# EAGLE design tranc_3b (EAGLE 9.6.2)
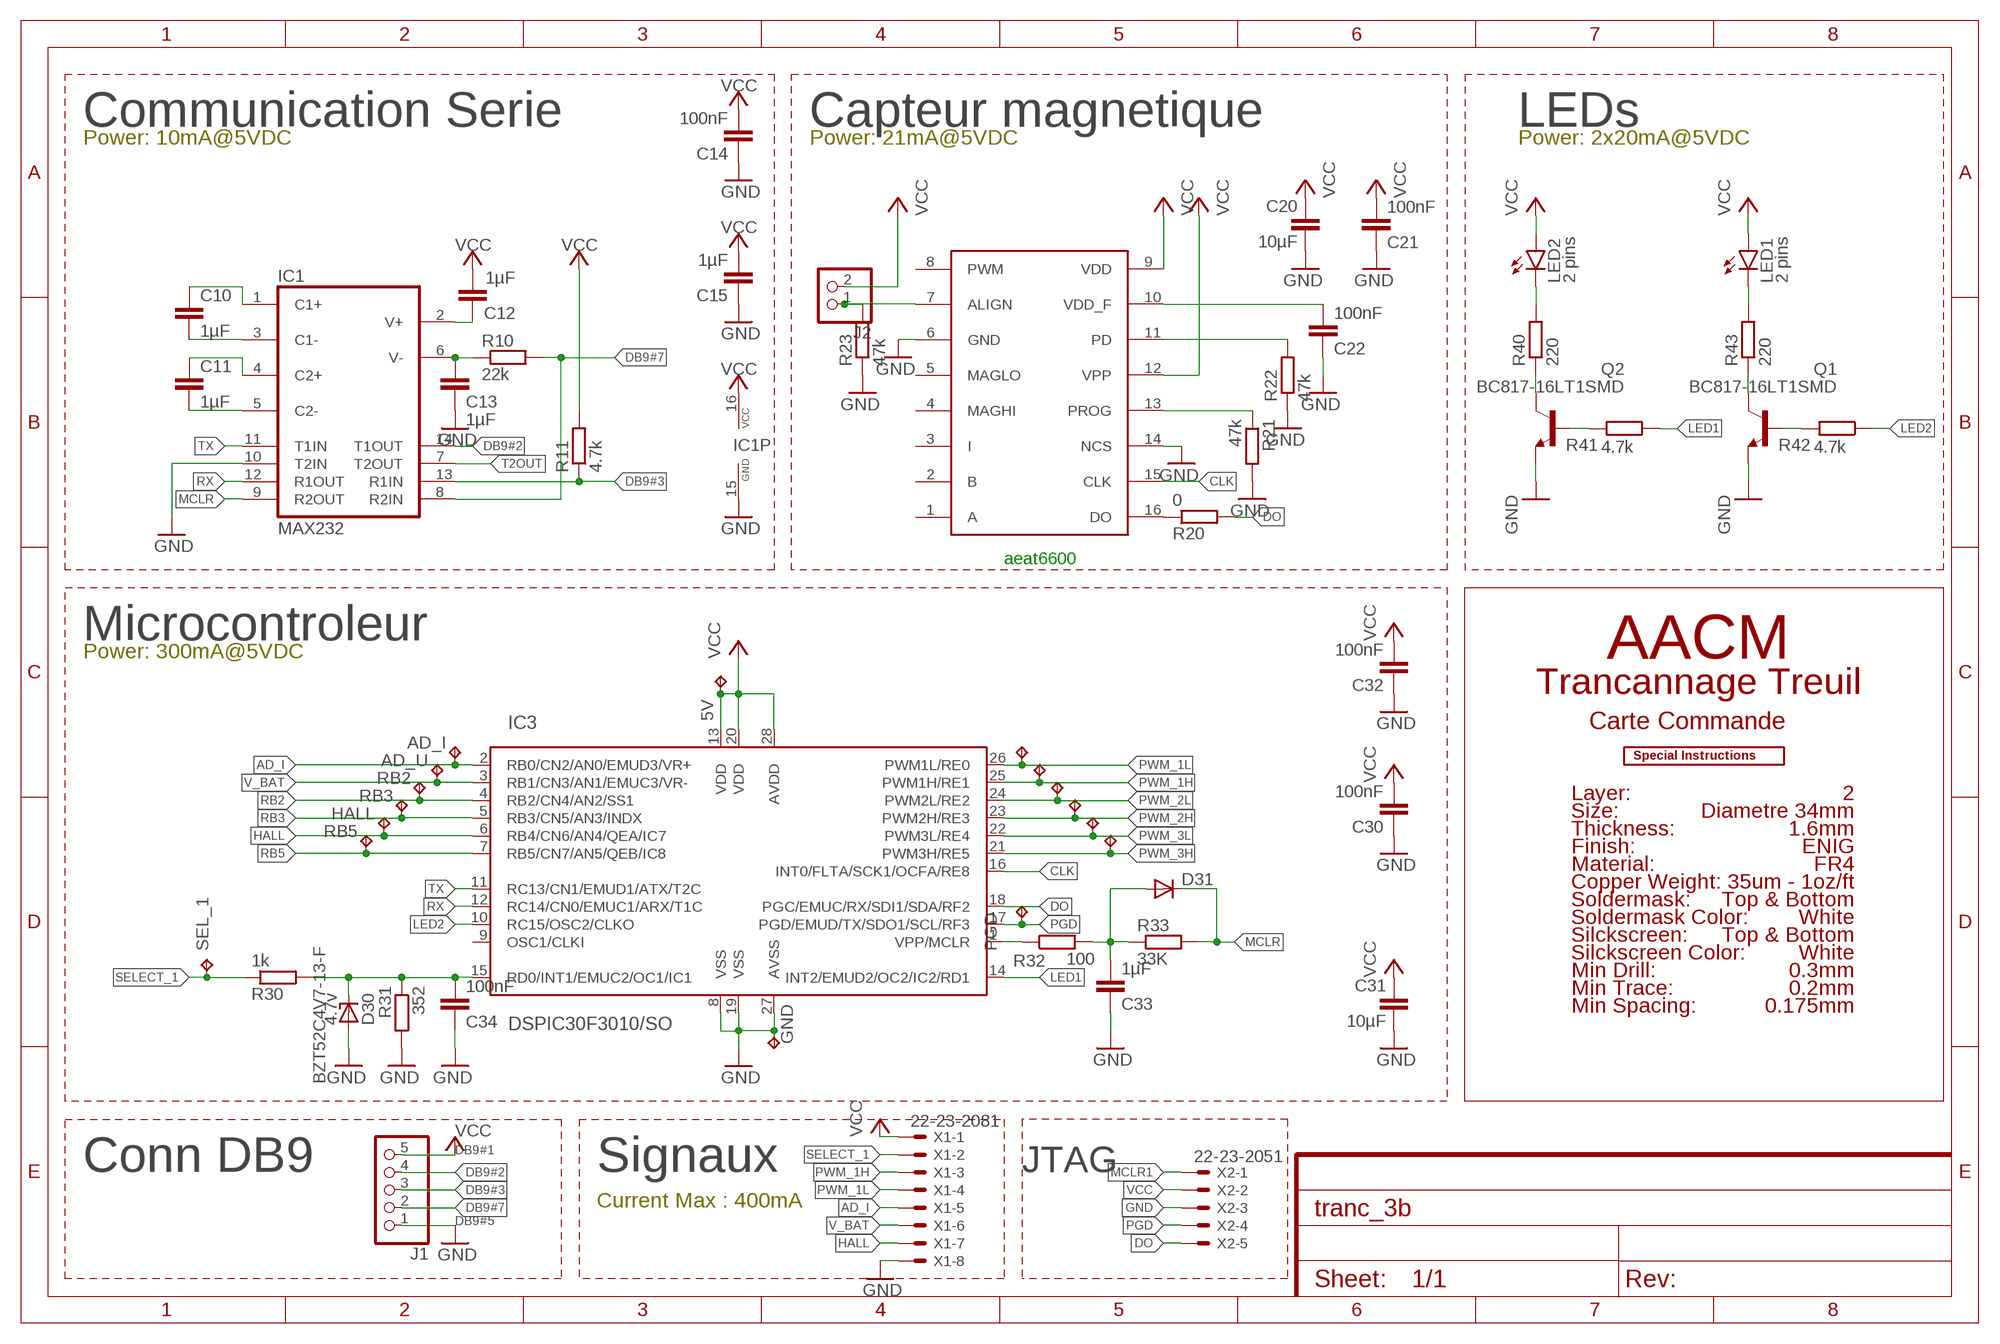
[diagram p0: schematic, sheet 1]

## Parts
1H  TPB1,27  [B1,27]
1L  TPB1,27  [B1,27]
2H  TPB1,27  [B1,27]
2L  TPB1,27  [B1,27]
3H  TPB1,27  [B1,27]
3L  TPB1,27  [B1,27]
5V  TPB1,27  [B1,27]
AD_I  TPB1,27  [B1,27]
AD_U  TPB1,27  [B1,27]
C10  1µF  C-EUC0603  [C0603]
C11  1µF  C-EUC0603  [C0603]
C12  1µF  C-EUC0603  [C0603]
C13  1µF  C-EUC0603  [C0603]
C14  100nF  C-EUC0603  [C0603]
C15  1µF  C-EUC0603  [C0603]
C20  10µF  C-EUC1210  [C1210]
C21  100nF  C-EUC0603  [C0603]
C22  100nF  C-EUC0603  [C0603]
C30  100nF  C-EUC0603  [C0603]
C31  10µF  C-EUC1210  [C1210]
C32  100nF  C-EUC0603  [C0603]
C33  1µF  C-EUC0603  [C0603]
C34  100nF  C-EUC0603  [C0603]
D30  4.7v  ZENER-DIODESOD80C  [SOD80C]
D31  DIODE-MINIMELF  [MINIMELF]
GND  TPB1,27  [B1,27]
HALL  TPB1,27  [B1,27]
IC1  MAX232  [SO16]
IC2  AVAGO_AEAT-6600TSSOP16  [AVAGO_TSSOP16]
IC3  DSPIC30F3010/SO  [SO-28W]
J1  PINHD-1X55X2MM  [1_05X2MM]
J2  PINHD-1X2  [1X02]
LED1  2 pins  LED3MM  [LED3MM]
LED2  2 pins  LED3MM  [LED3MM]
PGD  TPB1,27  [B1,27]
Q1  BC817-16LT1SMD  [SOT23-BEC]
Q2  BC817-16LT1SMD  [SOT23-BEC]
R10  22k  R-EU_R0603  [R0603]
R11  4.7k  R-EU_R0603  [R0603]
R20  0  R-EU_R0603  [R0603]
R21  47k  R-EU_R0603  [R0603]
R22  47k  R-EU_R0603  [R0603]
R23  47k  R-EU_R0603  [R0603]
R30  1k  R-EU_R0603  [R0603]
R31  352  R-EU_R0603  [R0603]
R32  100  R-EU_R0603  [R0603]
R33  33K  R-EU_R0603  [R0603]
R40  220  R-EU_R0603  [R0603]
R41  4.7k  R-EU_R0603  [R0603]
R42  4.7k  R-EU_R0603  [R0603]
R43  220  R-EU_R0603  [R0603]
RB2  TPB1,27  [B1,27]
RB3  TPB1,27  [B1,27]
RB5  TPB1,27  [B1,27]
SEL_1  TPB1,27  [B1,27]
U$1  SPECIAL_INSTRUCTIONS-PRODUCTION  [PRODUCTION_INSTRUCTIONS]
X1  22-23-2081  [22-23-2081]
X2  22-23-2051  [22-23-2051]

## Nets
AD_I: AD_I.TP IC3.2(RB0/CN2/AN0/EMUD3/VR+) X1.5
ALIGN: IC2.7(ALIGN) J2.1 R23.2
BASEL1: Q1.C R43.1
BASEL2: Q2.C R40.1
C1+: C10.1 IC1.1(C1+)
C1-: C10.2 IC1.3(C1-)
C2+: C11.1 IC1.4(C2+)
C2-: C11.2 IC1.5(C2-)
CLK: IC2.15(CLK) IC3.16(INT0/FLTA/SCK1/OCFA/RE8)
DB9#2: IC1.14(T1OUT) J1.4
DB9#3: IC1.13(R1IN) J1.3 R11.1
DB9#7: IC1.8(R2IN) J1.2 R10.2
DO: IC3.18(PGC/EMUC/RX/SDI1/SDA/RF2) R20.2 X2.5
DO_1: IC2.16(DO) R20.1
GND: C13.2 C14.1 C15.1 C20.2 C21.1 C22.1 C30.1 C31.2 C32.1 C33.1 C34.1 D30.A GND.TP IC1.10(T2IN) IC1.15(GND) IC2.6(GND) IC2.14(NCS) IC3.8(VSS) IC3.19(VSS) IC3.27(AVSS) J1.1 Q1.E Q2.E R21.2 R22.1 R23.1 R31.2 X1.8 X2.3
HALL: HALL.TP IC3.6(RB4/CN6/AN4/QEA/IC7) X1.7
KL1: LED1.K(C) R43.2
KL2: LED2.K(C) R40.2
LED1: IC3.14(INT2/EMUD2/OC2/IC2/RD1) R41.1
LED1GATE: Q2.B R41.2
LED2: IC3.10(RC15/OSC2/CLKO) R42.1
LED2GATE: Q1.B R42.2
MCLR: D31.C IC1.9(R2OUT) R33.2
MCLR1: IC3.1(VPP/MCLR) R32.1 X2.1
MCLR2: C33.2 D31.A R32.2 R33.1
PGD: IC3.17(PGD/EMUD/TX/SDO1/SCL/RF3) PGD.TP X2.4
POWERDOWN: IC2.11(PD) R22.2
PROG: IC2.13(PROG) R21.1
PWM_1H: 1H.TP IC3.25(PWM1H/RE1) X1.3
PWM_1L: 1L.TP IC3.26(PWM1L/RE0) X1.4
PWM_2H: 2H.TP IC3.23(PWM2H/RE3)
PWM_2L: 2L.TP IC3.24(PWM2L/RE2)
PWM_3H: 3H.TP IC3.21(PWM3H/RE5)
PWM_3L: 3L.TP IC3.22(PWM3L/RE4)
RB2: IC3.4(RB2/CN4/AN2/SS1) RB2.TP
RB3: IC3.5(RB3/CN5/AN3/INDX) RB3.TP
RB5: IC3.7(RB5/CN7/AN5/QEB/IC8) RB5.TP
RX: IC1.12(R1OUT) IC3.12(RC14/CN0/EMUC1/ARX/T1C)
SELECT: C34.2 D30.C IC3.15(RD0/INT1/EMUC2/OC1/IC1) R30.2 R31.1
SELECT_1: R30.1 SEL_1.TP X1.2
T2OUT: IC1.7(T2OUT)
TX: IC1.11(T1IN) IC3.11(RC13/CN1/EMUD1/ATX/T2C)
V+232: C12.1 IC1.2(V+)
V-232: C13.1 IC1.6(V-) R10.1
V_BAT: AD_U.TP IC3.3(RB1/CN3/AN1/EMUC3/VR-) X1.6
VCC: 5V.TP C12.2 C14.2 C15.2 C20.1 C21.2 C30.2 C31.1 C32.2 IC1.16(VCC) IC2.9(VDD) IC2.12(VPP) IC3.13(VDD) IC3.20(VDD) IC3.28(AVDD) J1.5 J2.2 LED1.A LED2.A R11.2 X1.1 X2.2
VDD_F: C22.2 IC2.10(VDD_F)
Unconnected: IC2.1(A) IC2.2(B) IC2.3(I) IC2.4(MAGHI) IC2.5(MAGLO) IC2.8(PWM) IC3.9(OSC1/CLKI)

## Notes on the sheet
- Communication Serie | Capteur magnetique | LEDs
- Power: 10mA@5VDC | Power: 21mA@5VDC | Power: 2x20mA@5VDC
- aeat6600
- Microcontroleur
- Power: 300mA@5VDC | AACM
- Trancannage Treuil
- Carte Commande
- Layer: | 2
- Size: | Diametre 34mm
- Thickness: | 1.6mm
- Finish: | ENIG
- Material: | FR4
- Copper Weight: | 35um - 1oz/ft
- Soldermask: | Top & Bottom
- Soldermask Color: | White
- Silckscreen: | Top & Bottom
- Silckscreen Color: | White
- Min Drill: | 0.3mm
- Min Trace: | 0.2mm
- Min Spacing: | 0.175mm
- DB9#1
- Conn DB9 | Signaux | JTAG
- Current Max : 400mA
- DB9#5

## Library data of the parts
1H 1L 2H 2L 3H 3L 5V AD_I AD_U GND HALL PGD RB2 RB3 RB5 SEL_1 = testpad:TP: Test pad
C10-C15 C20-C22 C30-C34 = rcl:C-EU: CAPACITOR, European symbol; SPICEPREFIX: C
D30 = diode:ZENER-DIODE: Z-Diode; REF: BZT52C4V7-13-F
D31 = diode:DIODE-: DIODE
IC1 = maxim:MAX232: RS232 TRANSCEIVER; SPICEPREFIX: X
IC2 = aeat_6600_1:AVAGO_AEAT-6600
IC3 = microchip-dspic:DSPIC30F3010: dsPIC Motion Controller DSC
J1 = pinhead:PINHD-1X5: PIN HEADER
J2 = pinhead:PINHD-1X2: PIN HEADER
LED1 LED2 = led:LED: LED OSRAM: - CHIPLED LG R971, LG N971, LY N971, LG Q971, LY Q971, LO R971, LY R971 LH N974, LH R974 LS Q976, LO Q976, LY Q976 LO Q996 - Hyper CHIPLED LW Q18S LB Q993, LB Q99A, LB R99A - SideLED LS A670, LO A670, LY A670, LG A670, LP A670 LB A673, LV A673, LT A673, LW A673 LH A674 LY A675 LS A676, LA A676, LO A676, LY A676, LW A676 LS A679, LY A679, LG A679 - Hyper Micro SIDELED® LS Y876, LA Y876, LO Y876, LY Y876 LT Y87S - SmartLED LW L88C, LW L88S LB L89C, LB L89S, LG L890 LS L89K, LO L89K, LY L89K LS L896, LA L896, LO L896, LY L896 - TOPLED LS T670, LO T670, LY T670, LG T670, LP T670 LSG T670, LSP T670, LSY T670, LOP T670, LYG T670 LG T671, LOG T671, LSG T671 LB T673, LV T673, LT T673, LW T673 LH T674 LS T676, LA T676, LO T676, LY T676, LB T676, LH T676, LSB T676, LW T676 LB T67C, LV T67C, LT T67C, LS T67K, LO T67K, LY T67K, LW E67C LS E67B, LA E67B, LO E67B, LY E67B, LB E67C, LV E67C, LT E67C LW T67C LS T679, LY T679, LG T679 LS T770, LO T770, LY T770, LG T770, LP T770 LB T773, LV T773, LT T773, LW T773 LH T774 LS E675, LA E675, LY E675, LS T675 LS T776, LA T776, LO T776, LY T776, LB T776 LHGB T686 LT T68C, LB T68C - Hyper Mini TOPLED® LB M676 - Mini TOPLED Santana® LG M470 LS M47K, LO M47K, LY M47K Source: http://www.osram.convergy.de LUXEON: - LUMILED® LXK2-PW12-R00, LXK2-PW12-S00, LXK2-PW14-U00, LXK2-PW14-V00 LXK2-PM12-R00, LXK2-PM12-S00, LXK2-PM14-U00 LXK2-PE12-Q00, LXK2-PE12-R00, LXK2-PE12-S00, LXK2-PE14-T00, LXK2-PE14-U00 LXK2-PB12-K00, LXK2-PB12-L00, LXK2-PB12-M00, LXK2-PB14-N00, LXK2-PB14-P00, LXK2-PB14-Q00 LXK2-PR12-L00, LXK2-PR12-M00, LXK2-PR14-Q00, LXK2-PR14-R00 LXK2-PD12-Q00, LXK2-PD12-R00, LXK2-PD12-S00 LXK2-PH12-R00, LXK2-PH12-S00 LXK2-PL12-P00, LXK2-PL12-Q00, LXK2-PL12-R00 Source: www.luxeon.com KINGBRIGHT: KA-3528ASYC Source: www.kingbright.com
Q1 Q2 = transistor-npn:BC817*: NPN Transistor
R10 R11 R20-R23 R30-R33 R40-R43 = rcl:R-EU_: RESISTOR, European symbol; SPICEPREFIX: R
U$1 = SparkFun-Aesthetics:SPECIAL_INSTRUCTIONS: Special Ordering/Production Instructions Alert Symbol for special PCB ordering instructions or unique production process warnings. Ordering Instructions Production Instructions Types of information that should be added to box: Copper weight Soldermask color Silk color PCB thickness Number of layers PCB Standard: 1.6mm FR4 1 oz copper immersion silver plating red soldermask white silkscreen Types of information that should be added to box: Special wash requirements Depaneling instructions Humidification Glue curing Default text settings: 0.07 inch 9% ratio 50% line distance
X1 = con-molex:22-23-2081: .100" (2.54mm) Center Header - 8 Pin; MF: MOLEX; MPN: 22-23-2081; OC_FARNELL: 1756826; OC_NEWARK: 01C7592
X2 = con-molex:22-23-2051: .100" (2.54mm) Center Header - 5 Pin; MF: MOLEX; MPN: 22-23-2051; OC_FARNELL: 1462952; OC_NEWARK: 38C9178

## Board
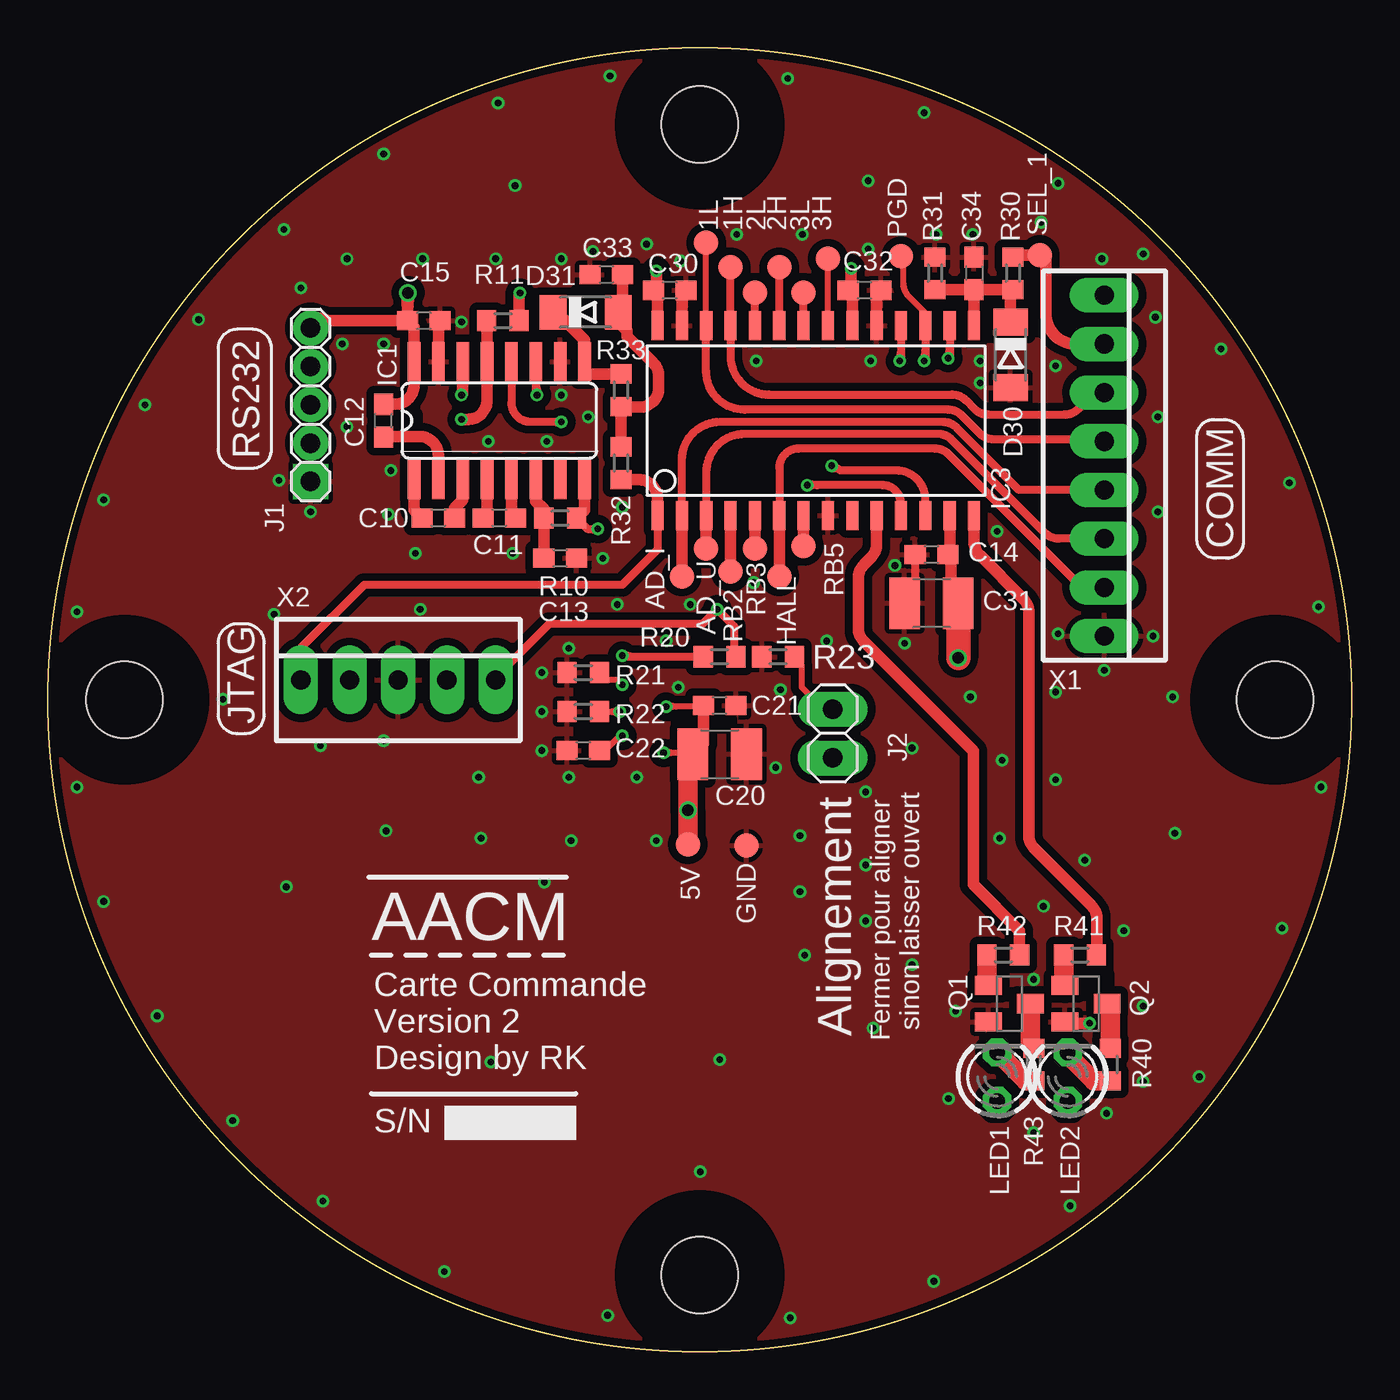
[diagram p1: board, top side]
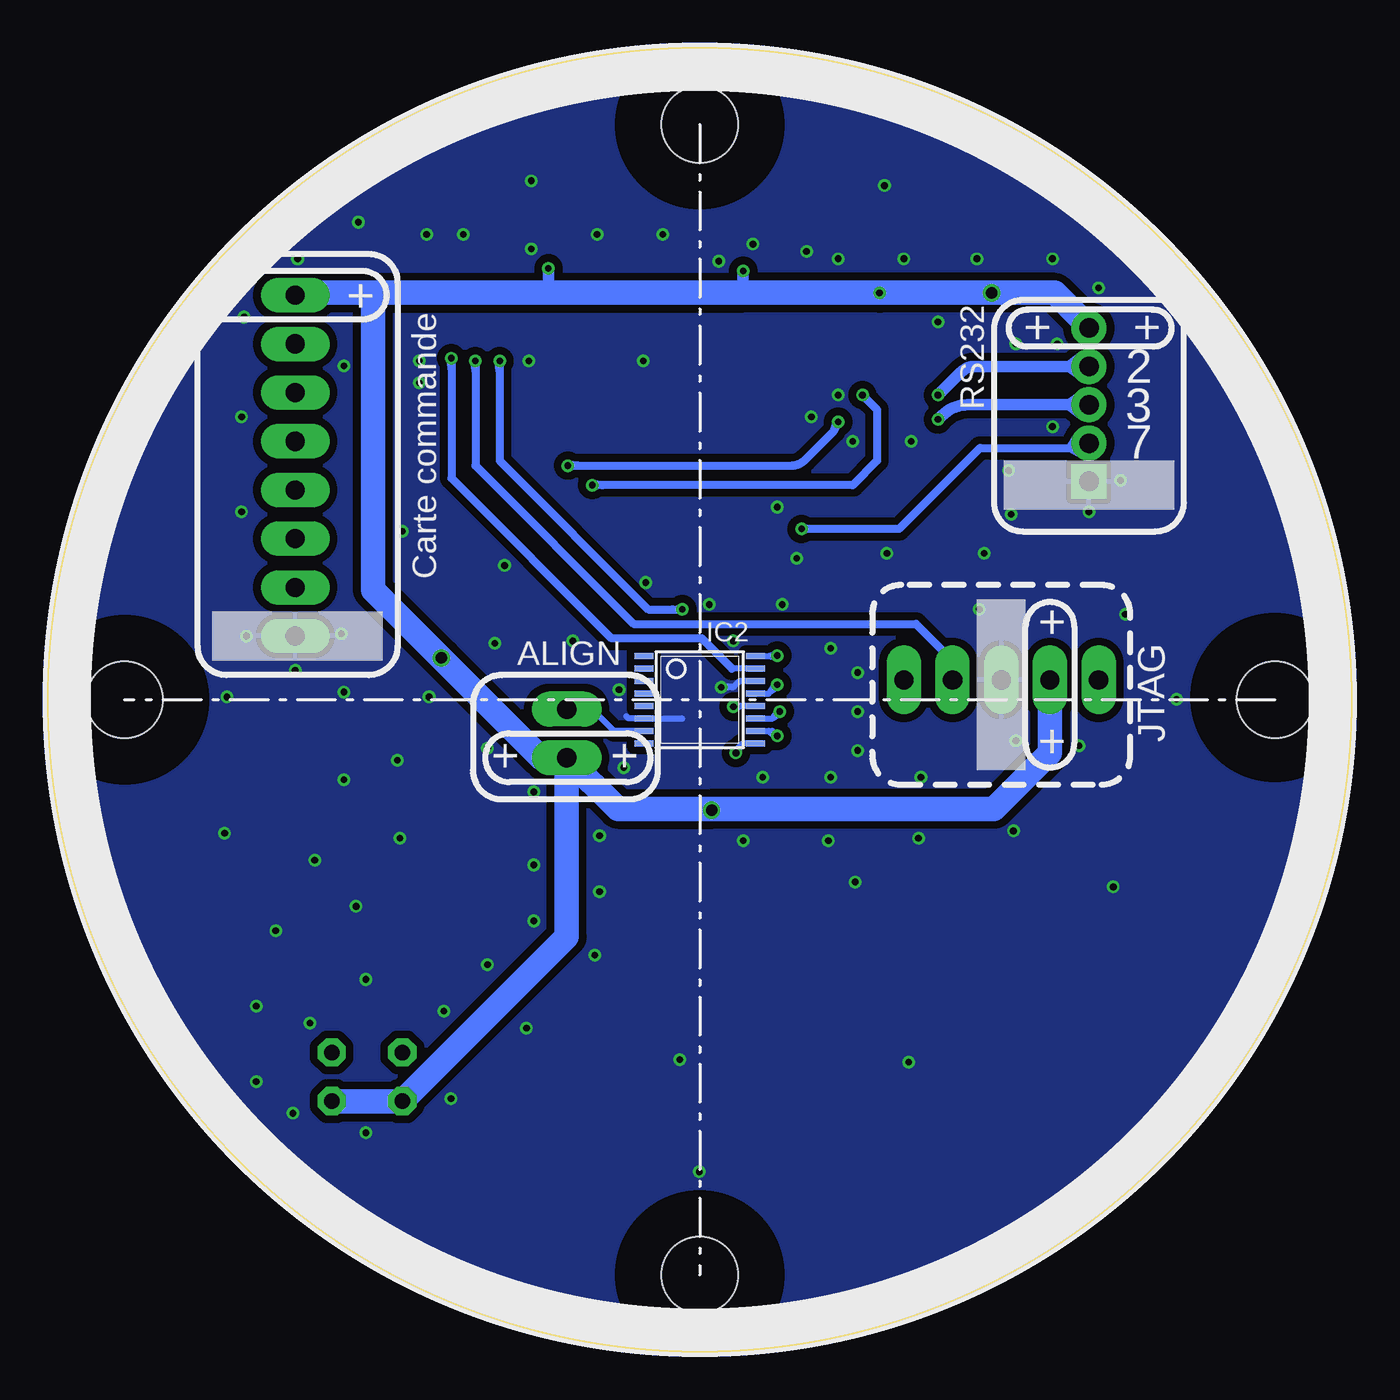
[diagram p2: board, bottom side, seen from below]

Size 68 x 68 mm. Coordinates in mm from the lower left corner, seen from the top.
Outline: circle at 34,34 radius 34
Copper layers (1*16): Top 0.035mm / dielectric 1.6mm / Bottom 0.035mm
Design rules "jlcpcb-2layers *": minimum track width 5mil, minimum drill 0.3mm, track to track 5mil, track to pad 5mil, pad to pad 5mil, via to via 5mil, smd to smd 5mil, copper to edge 0.2mm, drill to drill 6mil, minimum pad ring 10mil, minimum via ring 6mil, stop-mask expansion 4mil, vias tented up to drill 14mil, thermal gap 10mil
Holes 4 mm at 34,64 64,34 4,34 34,4
tRestrict: area 30,60 to 38,68; area 60,30 to 68,38; area 0,30 to 8,38; area 30,0 to 38,8; area 30,60 to 38,68; area 26.5,42 to 27.9,42.7; area 32.6,52.2 to 33.5,52.6; area 34.9,32.6 to 35.5,33; area 54.2,19 to 55.2,19.7; area 18.4,48.1 to 19.2,48.9; area 27.7,55 to 28.6,55.4; area 27.8,34.1 to 28.2,34.8; area 27.8,32.1 to 28.2,32.7; area 50,16.5 to 50.7,17.5; area 52.9,55.7 to 53.5,56
bRestrict: area 30,60 to 38,68; area 0,30.1 to 8,38.1; area 60,30 to 68,38; area 30,0 to 38,8

### Footprints (pad centres in the part's own frame; a part is rotated, then mirrored left to right if it is on the bottom)
B1,27 = smd 1.27 x 1.27: TP 0,0
C0603 = smd 1.1 x 1: 1 -0.85,0; 2 0.85,0
C1210 = smd 1.6 x 2.7: 1 -1.4,0; 2 1.4,0
SOD80C = smd 1.4 x 1.8: A 1.7,0; C -1.7,0
MINIMELF = smd 1.4 x 1.8: A 1.7,0; C -1.7,0
SO16 = smd 0.66 x 2.032: 1 -4.445,-3.073; 2 -3.175,-3.073; 3 -1.905,-3.073; 4 -0.635,-3.073; 5 0.635,-3.073; 6 1.905,-3.073; 7 3.175,-3.073; 8 4.445,-3.073; 9 4.445,3.073; 10 3.175,3.073; 11 1.905,3.073; 12 0.635,3.073; 13 -0.635,3.073; 14 -1.905,3.073; 15 -3.175,3.073; 16 -4.445,3.073
AVAGO_TSSOP16 = smd 0.305 x 0.991: 1 -2.275,-2.918; 2 -1.625,-2.918; 3 -0.975,-2.918; 4 -0.325,-2.918; 5 0.325,-2.918; 6 0.975,-2.918; 7 1.625,-2.918; 8 2.275,-2.918; 9 2.275,2.918; 10 1.625,2.918; 11 0.975,2.918; 12 0.325,2.918; 13 -0.325,2.918; 14 -0.975,2.918; 15 -1.625,2.918; 16 -2.275,2.918
SO-28W = smd 0.635 x 1.524: 1 -7.62,-4.953; 2 -6.35,-4.953; 3 -5.08,-4.953; 4 -3.81,-4.953; 5 -2.54,-4.953; 6 -1.27,-4.953; 7 0,-4.953; 8 1.27,-4.953; 9 2.54,-4.953; 10 3.81,-4.953; 11 5.08,-4.953; 12 6.35,-4.953; 13 7.62,-4.953; 14 8.89,-4.953; 15 8.89,4.953; 16 7.62,4.953; 17 6.35,4.953; 18 5.08,4.953; 19 3.81,4.953; 20 2.54,4.953; 21 1.27,4.953; 22 0,4.953; 23 -1.27,4.953; 24 -2.54,4.953; 25 -3.81,4.953; 26 -5.08,4.953; 27 -6.35,4.953; 28 -7.62,4.953
1_05X2MM = drill 1.016 pad 1.3 square: 1 -4,0 | drill 1.016 pad 1.3: 2 -2,0; 3 0,0; 4 2,0; 5 4,0
1X02 = drill 1.016 long: 1 -1.27,0; 2 1.27,0
LED3MM = drill 0.813 octagon: A -1.27,0; K 1.27,0
SOT23-BEC = smd 1 x 1.4: B -0.95,-1.1; C 0,1.1; E 0.95,-1.1
R0603 = smd 1 x 1.1: 1 -0.85,0; 2 0.85,0
22-23-2081 = drill 1 long: 1 -8.89,0; 2 -6.35,0; 3 -3.81,0; 4 -1.27,0; 5 1.27,0; 6 3.81,0; 7 6.35,0; 8 8.89,0
22-23-2051 = drill 1 long: 1 -5.08,0; 2 -2.54,0; 3 0,0; 4 2.54,0; 5 5.08,0

### Placement (x,y rotation side)
1H  35.61,56.56 270 top
1L  34.34,57.83 180 top
2H  38.15,56.56 270 top
2L  36.88,55.23 180 top
3H  40.69,57.01 180 top
3L  39.42,55.23 180 top
5V  33.38,26.46 270 top
AD_I  33.07,40.43 270 top
AD_U  34.34,41.89 270 top
C10  20.37,43.48 0 top
C11  23.54,43.48 0 top
C12  17.51,48.56 90 top
C13  26.72,41.38 0 top
C14  46.09,41.58 0 top
C15  19.61,53.77 180 top
C20  35.04,31.16 0 top
C21  35.04,33.7 180 top
C22  27.92,31.35 0 top
C30  32.43,55.35 180 top
C31  46.09,39.04 180 top
C32  42.59,55.35 180 top
C33  29.13,56.18 0 top
C34  48.31,56.24 270 top
D30  50.21,51.99 270 top
D31  28.05,54.21 0 top
GND  36.43,26.4 270 top
HALL  38.15,40.43 270 top
IC1  23.54,48.56 0 top
IC2  34,34 270 bottom
IC3  39.42,48.56 0 top
J1  13.7,49.39 90 top
J2  40.94,32.24 270 top
LED1  49.51,14.33 90 top
LED2  53.2,14.33 90 top
PGD  44.5,57.13 180 top
Q1  50.15,18.14 270 top
Q2  54.15,18.14 270 top
R10  26.72,43.48 0 top
R11  23.73,53.77 0 top
R20  35.04,36.24 0 top
R21  27.92,35.42 180 top
R22  27.92,33.38 0 top
R23  38.08,36.24 0 top
R30  50.34,56.24 270 top
R31  46.28,56.24 90 top
R32  29.89,46.34 90 top
R33  29.89,50.15 90 top
R40  55.42,14.97 270 top
R41  53.83,20.68 180 top
R42  49.83,20.68 180 top
R43  51.42,14.97 270 top
RB2  35.61,40.69 180 top
RB3  36.88,41.89 180 top
RB5  39.42,42.02 180 top
SEL_1  51.74,57.2 270 top
U$1  71.74,63.1 0 top  (outside the outline)
X1  55.1,46.21 270 top
X2  18.27,35.03 0 top

### Tracks (layer width: path | path; a pad name or v marks a point on that pad's centre or on a via)
AD_I
  Top 0.406: IC3.2 33.07,46.5 arc-90 35.07,48.5 46.69,48.5 arc-45 47.39,48.2 50.66,44.94 X1.5
  Top 0.61: IC3.2 AD_I.TP
ALIGN
  Top 0.305: R23.2 39.31,35.8 39.31,34.65 40.46,33.51 J2.1
  Bottom 0.305: IC2.7 38.47,32.38 39.61,33.51 J2.1
BASEL1
  Top 1.016: Q1.C 51.25,15.99 R43.1
BASEL2
  Top 1.016: R40.1 55.42,17.97 Q2.C
C1+
  Top 0.61: C10.1 19.1,43.9 IC1.1
C1-
  Top 0.61: IC1.3 21.64,44.41 21.22,43.99 C10.2
C2+
  Top 0.61: IC1.4 22.91,43.7 C11.1
C2-
  Top 0.61: IC1.5 24.18,43.7 C11.2
CLK  (via drill 0.35)
  Top 0.406: IC3.16 47.04,52.34 | 47.04,52.34 47.04,51.9 v46.96,51.82 | 47.04,52.34 46.91,51.83 v46.96,51.82 | 47.04,52.34 47,51.81 v46.96,51.82
  Bottom 0.305: IC2.15 32.32,35.62
  Bottom 0.406: v46.96,51.82 46.96,51.29 | 46.96,51.29 46.96,45.56 38.59,37.19 33.89,37.19 32.32,35.62 | 46.96,51.29 47,51.81 v46.96,51.82 | 46.96,51.29 46.91,51.81 v46.96,51.82
DB9#2  (via drill 0.35)
  Top 0.61: IC1.14 21.64,49.96 v21.57,49.89
  Bottom 0.61: v21.57,49.89 20.38,51.09 arc45 19.67,51.39 14.72,51.39 | 14.72,51.39 J1.4 | 14.72,51.39 14.07,51.87 J1.4 | 14.72,51.39 14.07,50.9 J1.4
DB9#3  (via drill 0.35)
  Top 0.61: R11.1 22.91,53.74 IC1.13 22.91,49.62 arc-90 21.91,48.62 v21.57,48.62
  Bottom 0.61: J1.3 14.72,49.39 | 14.72,49.39 20.02,49.39 arc-45 21.37,48.82 v21.57,48.62 | 14.72,49.39 14.07,49.87 J1.3 | 14.72,49.39 14.07,48.9 J1.3
DB9#7  (via drill 0.35)
  Top 0.406: R10.2 28.14,42.91 28.16,42.91 | 28.16,42.91 v28.69,42.91 | 28.16,42.91 28.68,42.86 v28.69,42.91 | 28.16,42.91 28.68,42.96 v28.69,42.91
  Top 0.61: IC1.8 27.99,43.9 R10.2
  Bottom 0.406: 28.16,42.91 23.61,42.91 19.38,47.13 14.68,47.13 | 28.16,42.91 v28.69,42.91 | 14.68,47.13 13.95,47.13 J1.2 | 28.16,42.91 28.68,42.86 v28.69,42.91 | 28.16,42.91 28.68,42.96 v28.69,42.91 | 14.68,47.13 14.31,47.75 J1.2 | 14.68,47.13 14.05,46.77 J1.2
DO  (via drill 0.35)
  Top 0.406: IC3.18 44.5,52.19 | 44.5,52.19 44.5,51.74 v44.43,51.67 | v34.91,38.72 35.28,38.35 | 35.28,38.35 35.8,37.83 35.8,36.33 R20.2 | v34.91,38.72 34.54,38.35 | 34.54,38.35 34.15,37.96 26.15,37.96 23.35,35.16 X2.5 | 44.5,52.19 44.39,51.68 v44.43,51.67 | 44.5,52.19 44.48,51.67 v44.43,51.67 | 35.28,38.35 34.95,38.75 v34.91,38.72 | 35.28,38.35 34.88,38.68 v34.91,38.72 | 34.54,38.35 34.94,38.68 v34.91,38.72 | 34.54,38.35 34.87,38.75 v34.91,38.72
  Bottom 0.406: v44.43,51.67 44.43,51.15 | 44.43,51.15 44.43,46.47 36.69,38.72 35.43,38.72 | 35.43,38.72 v34.91,38.72 | 44.43,51.15 44.48,51.67 v44.43,51.67 | 44.43,51.15 44.39,51.67 v44.43,51.67 | 35.43,38.72 34.91,38.77 v34.91,38.72 | 35.43,38.72 34.91,38.67 v34.91,38.72
DO_1  (via drill 0.35)
  Top 0.406: R20.1 30.48,36.24 | 30.48,36.24 30.02,36.24 v29.96,36.3 | 30.48,36.24 29.97,36.35 v29.96,36.3 | 30.48,36.24 29.95,36.26 v29.96,36.3
  Bottom 0.254: 29.99,36.27 v29.96,36.3
  Bottom 0.305: IC2.16 30.48,36.27 | 30.48,36.27 29.99,36.27 | 30.48,36.27 29.98,36.4 v29.96,36.3 29.97,36.21 30.48,36.27
GND  (via drill 0.35)
  Top 0.406: C14.1 45.23,39.59 C31.2
  Top 0.61: IC1.15 20.37,53.68 C15.1 | IC3.19 43.23,55.14 C32.1 | IC3.27 33.07,55.14 C30.1 | v54.34,17.13 53.12,17.13 Q2.E
  Bottom 0.305: 34.91,33 34.93,33.02 IC2.6 37.73,33.02 37.83,33.13 | IC2.14 31.92,34.98 32.24,34.65 32.35,34.65 | 32.35,34.65 v32.88,34.65 | 32.35,34.65 32.86,34.56 v32.88,34.65 | 32.35,34.65 32.86,34.75 v32.88,34.65
  other vias: 29.32,66.53 38.59,66.4 66.28,38.84 66.41,29.45 38.72,1.76 29.19,1.89 1.51,29.45 1.51,38.59 9.13,34.02 34.02,9.38 58.66,34.15 28.43,57.39 26.78,49.89 21.57,53.7 28.94,41.38 19.16,41.64 15.61,48.24 17.76,43.67 13.7,43.8 12.05,45.45 17.51,52.56 37.96,30.46 44.18,41 44.69,36.94 57.64,37.32 55.1,35.54 52.69,37.45 48.62,50.53 48.62,51.67 2.91,23.48 5.7,17.51 9.64,12.05 14.34,7.86 20.68,4.17 46.21,3.67 53.32,7.6 60.05,14.33 64.37,22.08 64.75,45.32 61.2,52.31 57.13,57.26 52.69,60.94 45.7,64.63 2.91,44.43 5.06,49.39 7.86,53.83 12.3,58.53 17.51,62.47 23.48,65.13 17.51,31.86 19.41,38.72 24.37,60.82 42.78,61.07 51.42,11.41 46.97,13.19 43.04,16.87 39.48,20.68 39.23,23.99 39.23,26.91 42.66,29.19 42.66,25.38 42.66,22.46 45.07,20.18 47.35,17.76 45.07,31.48 48.12,34.15 52.56,34.4 52.56,29.83 54.09,25.64 56.12,21.95 57.13,18.02 57.13,14.08 55.23,12.43 25.77,31.35 14.21,31.61 12.43,24.24 25.89,24.49 23.1,15.1 13.19,55.48 15.61,57.01 19.54,57.01 23.35,57.01 26.78,57.01 31.23,57.77 33,56.88 35.92,58.28 39.35,58.28 42.78,57.51 46.34,58.28 48.24,58.28 51.8,58.91 54.98,57.01 57.77,53.96 57.9,48.75 57.9,43.8 35.04,15.22 58.78,27.03 36.94,51.67 42.91,51.67 22.97,47.48 22.46,29.95 51.93,23.22 49.77,30.84 49.64,26.78 52.56,51.42 40.62,37.07 27.16,29.95 30.72,29.95 25.77,33.38 25.77,35.42 24.24,41.64 11.79,38.46 28.18,48.75 15.35,52.56 17.89,45.96 29.7,38.97 27.16,36.69 33.51,38.97 38.21,34.53 31.73,26.65 27.29,26.65 22.59,26.78 17.64,27.16 51.42,19.41 26.02,47.48 29.96,44.05 32.24,37.07 36.81,40.11 49.51,42.78
  pour Top (isolate 0.406, rank 6): -1,69 69.45,69.39 69.45,-1.54 -1,-1
  pour Bottom (isolate 0.406): -1,69 71,69 69.71,-1.54 -1,-1.54
HALL
  Top 0.406: 38.15,44.05 38.15,46.1 arc-90 39.15,47.1 46.27,47.1 arc-45 46.98,46.81 53.93,39.86 X1.7
  Top 0.61: HALL.TP IC3.6 38.15,44.05
KL1
  Top 1.016: LED1.K 51,14.12 R43.2
KL2
  Top 1.016: R40.2 54.55,14.12 53.2,15.48 LED2.K
LED1
  Top 0.61: IC3.14 48.31,42.24 arc45 48.6,41.54 50.87,39.27 arc-45 51.16,38.56 51.16,26.94 arc45 51.46,26.23 54.43,23.26 arc-45 54.72,22.56 54.72,20.72 R41.1
LED1GATE
  Top 1.016: R41.2 52.98,19.16 Q2.B
LED2
  Top 0.61: IC3.10 43.23,42.12 arc-45 42.94,41.41 42.57,41.04 arc45 42.27,40.34 42.27,37.73 arc45 42.57,37.03 48.27,31.33 48.27,24.37 50.68,21.95 R42.1
LED2GATE
  Top 1.016: R42.2 48.98,19.16 Q1.B
MCLR
  Top 0.61: D31.C 26.53,54.21 27.99,52.75 IC1.9 27.99,51.23 28.22,51 R33.2
MCLR1
  Top 0.305: 13.19,36.69 X2.1
  Top 0.406: 13.19,36.69 16.49,39.99 29.96,39.99 31.8,41.83 IC3.1
  Top 0.61: IC3.1 31.8,44.49 arc90 30.8,45.49 R32.1
MCLR2
  Top 0.61: C33.2 29.98,54.44 D31.A 29.75,53.7 30.21,53.24 30.21,52.94 31.57,51.58 arc-45 31.86,50.88 31.86,50.26 arc-90 30.86,49.26 29.93,49.26 R33.1 R32.2
PGD  (via drill 0.35)
  Top 0.305: IC3.17 45.77,54.17 44.9,55.04 arc-45 44.61,55.74 44.61,57.02 PGD.TP
  Top 0.406: IC3.17 45.77,52.19 | 45.77,52.19 45.77,51.74 v45.7,51.67 | 45.77,52.19 45.66,51.68 v45.7,51.67 | 45.77,52.19 45.75,51.67 v45.7,51.67
  Bottom 0.406: v45.7,51.67 45.7,51.15 | 45.7,51.15 45.7,46.21 37.45,37.96 22.72,37.96 20.81,36.05 X2.4 | 45.7,51.15 45.75,51.67 v45.7,51.67 | 45.7,51.15 45.66,51.67 v45.7,51.67
POWERDOWN  (via drill 0.35)
  Top 0.305: R22.2 28.88,33.17 28.98,33.17 29.19,33.38 29.3,33.38 | 29.3,33.38 v29.83,33.38 | 29.3,33.38 29.81,33.29 v29.83,33.38 | 29.3,33.38 29.81,33.48 v29.83,33.38
  Bottom 0.305: IC2.11 30.21,33.02 | 30.21,33.02 30.19,33.02 v29.83,33.38 | 30.21,33.02 29.91,33.44 v29.83,33.38 | 30.21,33.02 29.78,33.3 v29.83,33.38
PROG  (via drill 0.35)
  Top 0.305: v29.96,34.78 29.7,35.03 29.16,35.03 R21.1 | v29.96,34.78 29.9,34.75 29.71,35.02 29.99,34.84 v29.96,34.78
  Bottom 0.305: IC2.13 30.41,34.33 30.33,34.41 | 30.33,34.41 v29.96,34.78 | 30.33,34.41 30.04,34.84 v29.96,34.78 | 30.33,34.41 29.9,34.7 v29.96,34.78
PWM_1H
  Top 0.406: 1H.TP IC3.25 35.61,51.92 arc90 37.61,49.92 47.17,49.92 arc-45 47.88,49.63 48.33,49.17 arc45 49.04,48.88 53.04,48.88 arc45 53.74,49.17 54.59,50.02 X1.3
PWM_1L
  Top 0.305: IC3.26 1L.TP
  Top 0.406: IC3.26 34.34,51.13 arc90 36.34,49.13 46.95,49.13 arc-45 47.66,48.84 48.62,47.88 arc45 49.33,47.58 53.92,47.58 54.02,47.48 X1.4
PWM_2H
  Top 0.406: IC3.23 2H.TP
PWM_2L
  Top 0.406: IC3.24 2L.TP
PWM_3H
  Top 0.305: IC3.21 3H.TP
PWM_3L
  Top 0.406: IC3.22 3L.TP
RB2
  Top 0.61: IC3.4 RB2.TP
RB3
  Top 0.61: IC3.5 RB3.TP
RB5
  Top 0.61: IC3.7 RB5.TP
RX  (via drill 0.35)
  Top 0.406: IC3.12 45.77,44.46 arc45 45.33,45.52 arc45 44.27,45.96 41.34,45.96 | IC1.12 24.18,49.5 arc90 25.18,48.5 26.26,48.5 | 26.26,48.5 v26.78,48.5 | 41.34,45.96 40.91,46.25 v40.88,46.21 40.86,46.17 40.97,46.12 41.05,46.08 41.34,45.96 | 26.26,48.5 26.78,48.45 v26.78,48.5 | 26.26,48.5 26.78,48.55 v26.78,48.5
  Bottom 0.406: v40.88,46.21 40.35,46.21 | 40.35,46.21 29.23,46.21 arc-45 28.52,46.5 27,48.02 | 26.86,48.42 v26.78,48.5 | 40.35,46.21 40.87,46.16 v40.88,46.21 | 40.35,46.21 40.87,46.26 v40.88,46.21 | 27,48.02 26.86,48.42 | 26.86,48.42 26.83,48.51 v26.78,48.5 | 27,48.02 26.74,48.47 v26.78,48.5
SELECT
  Top 0.61: IC3.15 C34.2 | C34.2 R31.1 | C34.2 R30.2 50.21,55.27 D30.C
SELECT_1
  Top 0.61: R30.1 50.44,57.2 SEL_1.TP 52.05,56.88 52.05,54.12 arc45 52.51,53.02 arc45 53.61,52.56 X1.2
TX  (via drill 0.35)
  Top 0.406: IC3.11 44.5,44.21 arc45 44.2,44.92 arc45 43.53,45.2 40.13,45.2 | 40.13,45.2 v39.61,45.2 | IC1.11 25.45,50.41 | 25.45,50.41 25.45,49.96 v25.51,49.89 | 40.13,45.2 39.61,45.24 v39.61,45.2 | 40.13,45.2 39.61,45.15 v39.61,45.2 | 25.45,50.41 25.46,49.89 v25.51,49.89 | 25.45,50.41 25.56,49.9 v25.51,49.89
  Bottom 0.406: v25.51,49.89 25.14,49.52 | 25.14,49.52 24.75,49.13 24.75,46.47 26.02,45.2 39.08,45.2 | 39.08,45.2 v39.61,45.2 | 39.08,45.2 39.6,45.15 v39.61,45.2 | 39.08,45.2 39.6,45.24 v39.61,45.2 | 25.14,49.52 25.54,49.86 v25.51,49.89 | 25.14,49.52 25.47,49.92 v25.51,49.89
V+232
  Top 0.61: IC1.2 20.37,46.73 arc90 19.37,47.73 17.54,47.73 C12.1
V-232
  Top 0.61: IC1.6 25.45,44.37 25.87,43.95 R10.1 C13.1
V_BAT
  Top 0.406: IC3.3 34.34,45.86 arc-90 36.34,47.86 46.43,47.86 arc-45 47.14,47.57 52.02,42.69 arc45 52.72,42.4 X1.6
  Top 0.61: IC3.3 AD_U.TP
VCC  (via drill 0.35, 0.6)
  Top 0.305: C21.2 34.12,33.64 32.77,33.64 | 32.77,33.64 v32.24,33.64 | C20.1 33.26,31.16 33.19,31.23 32.64,31.23 | 32.64,31.23 v32.11,31.23 | 32.77,33.64 32.26,33.73 v32.24,33.64 | 32.77,33.64 32.26,33.54 v32.24,33.64 | 32.64,31.23 32.13,31.32 v32.11,31.23 | 32.64,31.23 32.13,31.13 v32.11,31.23
  Top 0.406: 19.1,53.42 C15.2
  Top 0.61: 19.1,53.42 IC1.16 19.1,50.41 arc-90 18.1,49.41 C12.2 | IC3.13 47.04,41.68 C14.2 47.1,41.41 47.1,39.42 C31.1 | IC3.20 41.96,55.14 C32.2 41.89,55.51 v41.89,56.5 | IC3.28 31.8,55.01 31.73,55.08 31.73,55.2 | 31.73,55.2 C30.2 | v18.78,55.23 18.76,55.2 18.76,54.33 | v31.73,56.37 31.73,55.2 | 33.38,28.3 33.38,29.14 | C21.2 34.19,31.71 C20.1 | v24.62,55.23 24.58,55.19 R11.2 | 18.76,54.33 C15.2 14.64,53.77 | 14.64,53.77 14.08,53.77 J1.5 | 18.76,54.33 18.85,55.22 v18.78,55.23 | 18.76,54.33 18.71,55.22 v18.78,55.23 | 33.38,29.14 33.31,28.25 v33.38,28.24 33.46,28.25 33.38,29.14 | 14.64,53.77 13.86,53.98 J1.5 | 14.64,53.77 14.22,53.07 J1.5
  Top 1.016: v33.38,28.24 33.38,28.3 | v33.38,28.24 5V.TP | v33.38,28.24 33.38,29.14 33.38,30.91 C20.1
  Top 1.27: C31.1 v47.48,36.18
  Bottom 0.254: 32.2,33.67 v32.24,33.64
  Bottom 0.305: IC2.12 31.72,33.67 | 31.72,33.67 32.2,33.67 | v32.11,31.23 32.11,31.36 31.82,31.66 | IC2.9 31.75,31.73 31.82,31.66 | 31.72,33.67 32.22,33.54 v32.24,33.64 32.23,33.74 31.72,33.67 | 31.82,31.66 32.02,31.18 v32.11,31.23 | 31.82,31.66 32.18,31.3 v32.11,31.23
  Bottom 0.61: J1.5 13.64,53.32 13.57,53.32 | v31.73,56.37 31.73,55.35 31.86,55.23 | v41.89,56.5 41.89,55.61 42.27,55.23
  Bottom 1.016: v33.38,28.24 33.32,28.3
  Bottom 1.27: 51.04,55.23 42.27,55.23 31.86,55.23 v24.62,55.23 15.48,55.23 13.57,53.32 | 51.04,55.23 51.04,39.73 v47.48,36.18 42.27,30.97 J2.2 | J2.2 38.27,28.3 33.32,28.3 18.65,28.3 15.73,31.23 X2.2 | LED2.A LED1.A 40.94,21.64 J2.2 | 51.04,55.23 54.98,55.23 X1.1
VDD_F  (via drill 0.35)
  Top 0.305: C22.2 29.16,31.45 29.59,31.87 | 29.59,31.87 29.85,32.14 29.87,32.17 v29.96,32.11 29.95,32.11 29.59,31.87
  Bottom 0.305: IC2.10 30.41,32.38 | 30.41,32.38 30.22,32.38 v29.96,32.11 | 30.41,32.38 29.92,32.21 v29.96,32.11 | 30.41,32.38 30.02,32.04 v29.96,32.11

### Text on the board
tNames: RS232 | COMM | JTAG | Alignement | Fermer pour aligner / sinon laisser ouvert | AACM | Carte Commande | Version 2 | Design by RK | S/N
bNames: Carte commande | + | + | + | 2 | RS232 | 3 | 7 | JTAG | + | ALIGN | + | + | +
bStop: - | - | - | - | - | -
tDocu: 5V | SEL_1 | CMD_1H | Carte commande sérigraphie top | CMD_1L | AD_I | V_BAT | HALL | GND | MCLR | 5V | GND | PGCD | DO